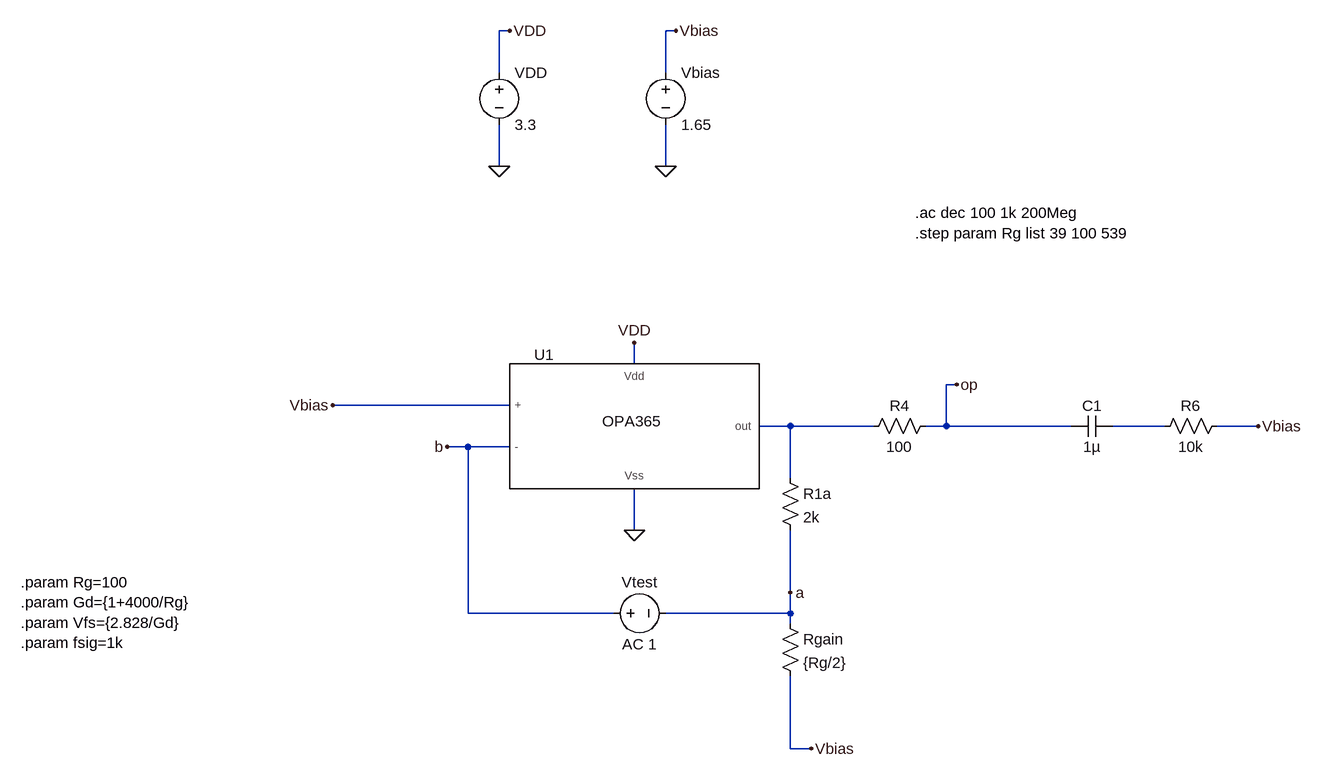
[diagram p0: schematic preamp_stability.asc]
preamp_stability.asc, the LTspice schematic file:
Version 4.1
SHEET 1 1468 1108
WIRE -80 -528 -96 -528
WIRE 176 -528 160 -528
WIRE -96 -464 -96 -528
WIRE 160 -464 160 -528
WIRE -96 -320 -96 -384
WIRE 160 -320 160 -384
WIRE 112 -16 112 -48
WIRE 608 16 592 16
WIRE -80 48 -352 48
WIRE 352 80 304 80
WIRE 480 80 352 80
WIRE 592 80 592 16
WIRE 592 80 560 80
WIRE 784 80 592 80
WIRE 928 80 848 80
WIRE 1072 80 1008 80
WIRE -144 112 -176 112
WIRE -80 112 -144 112
WIRE 352 160 352 80
WIRE 112 240 112 176
WIRE 352 336 352 240
WIRE -144 368 -144 112
WIRE 80 368 -144 368
WIRE 352 368 352 336
WIRE 352 368 160 368
WIRE 352 384 352 368
WIRE 352 576 352 464
WIRE 384 576 352 576
FLAG -352 48 Vbias
FLAG 160 -320 0
FLAG -96 -320 0
FLAG 176 -528 Vbias
FLAG -80 -528 VDD
FLAG 112 -48 VDD
FLAG 112 240 0
FLAG 1072 80 Vbias
FLAG 608 16 op
FLAG 384 576 Vbias
FLAG -176 112 b
FLAG 352 336 a
SYMBOL res 336 144 R0
SYMATTR InstName R1a
SYMATTR Value 2k
SYMBOL res 336 368 R0
SYMATTR InstName Rgain
SYMATTR Value {Rg/2}
SYMBOL res 576 64 R90
WINDOW 0 0 56 VBottom 2
WINDOW 3 32 56 VTop 2
SYMATTR InstName R4
SYMATTR Value 100
SYMBOL voltage -96 -480 R0
SYMATTR InstName VDD
SYMATTR Value 3.3
SYMBOL voltage 160 -480 R0
SYMATTR InstName Vbias
SYMATTR Value 1.65
SYMBOL res 1024 64 R90
WINDOW 0 0 56 VBottom 2
WINDOW 3 32 56 VTop 2
SYMATTR InstName R6
SYMATTR Value 10k
SYMBOL OPA365 112 80 R0
SYMATTR InstName U1
SYMBOL voltage 64 368 R270
WINDOW 0 32 56 VTop 2
WINDOW 3 -32 56 VBottom 2
SYMATTR InstName Vtest
SYMATTR Value AC 1
SYMBOL cap 848 64 R90
WINDOW 0 0 32 VBottom 2
WINDOW 3 32 32 VTop 2
SYMATTR InstName C1
SYMATTR Value 1µ
TEXT -832 320 Left 2 !.param Rg=100\n.param Gd={1+4000/Rg}\n.param Vfs={2.828/Gd}\n.param fsig=1k
TEXT 544 -248 Left 2 !.ac dec 100 1k 200Meg\n.step param Rg list 39 100 539

The netlist it stands for:
* preamp_stability.asc
R1a N001 a 2k
Rgain a Vbias {Rg/2}
R4 op N001 100
VDD VDD 0 3.3
Vbias Vbias 0 1.65
R6 Vbias N002 10k
X§U1 Vbias b VDD 0 N001 OPA365  ; pins + - Vdd Vss out
Vtest b a AC 1
C1 N002 op 1µ
.param Rg=100
.param Gd={1+4000/Rg}
.param Vfs={2.828/Gd}
.param fsig=1k
.ac dec 100 1k 200Meg
.step param Rg list 39 100 539
.lib OPA365.lib
.backanno
.end